# Altium schematic sheet Motor Connection V1.SchDoc: Motor Connection V1
size 302 x 228 mm; Origin: Eagle; Date: 5/3/2022 12:35:28 PM; SheetNumber: 1; GateName_1: G$1; SymbolName_1: FR-A4L; LibraryName: SparkFun-Aesthetics; DeviceSetName: FRAME-A4L; Sheet: Sheet:; CNAME: >CNAME; REV: V1; DESIGNER: Dharmik Patel; CREVISION: >CREVISION
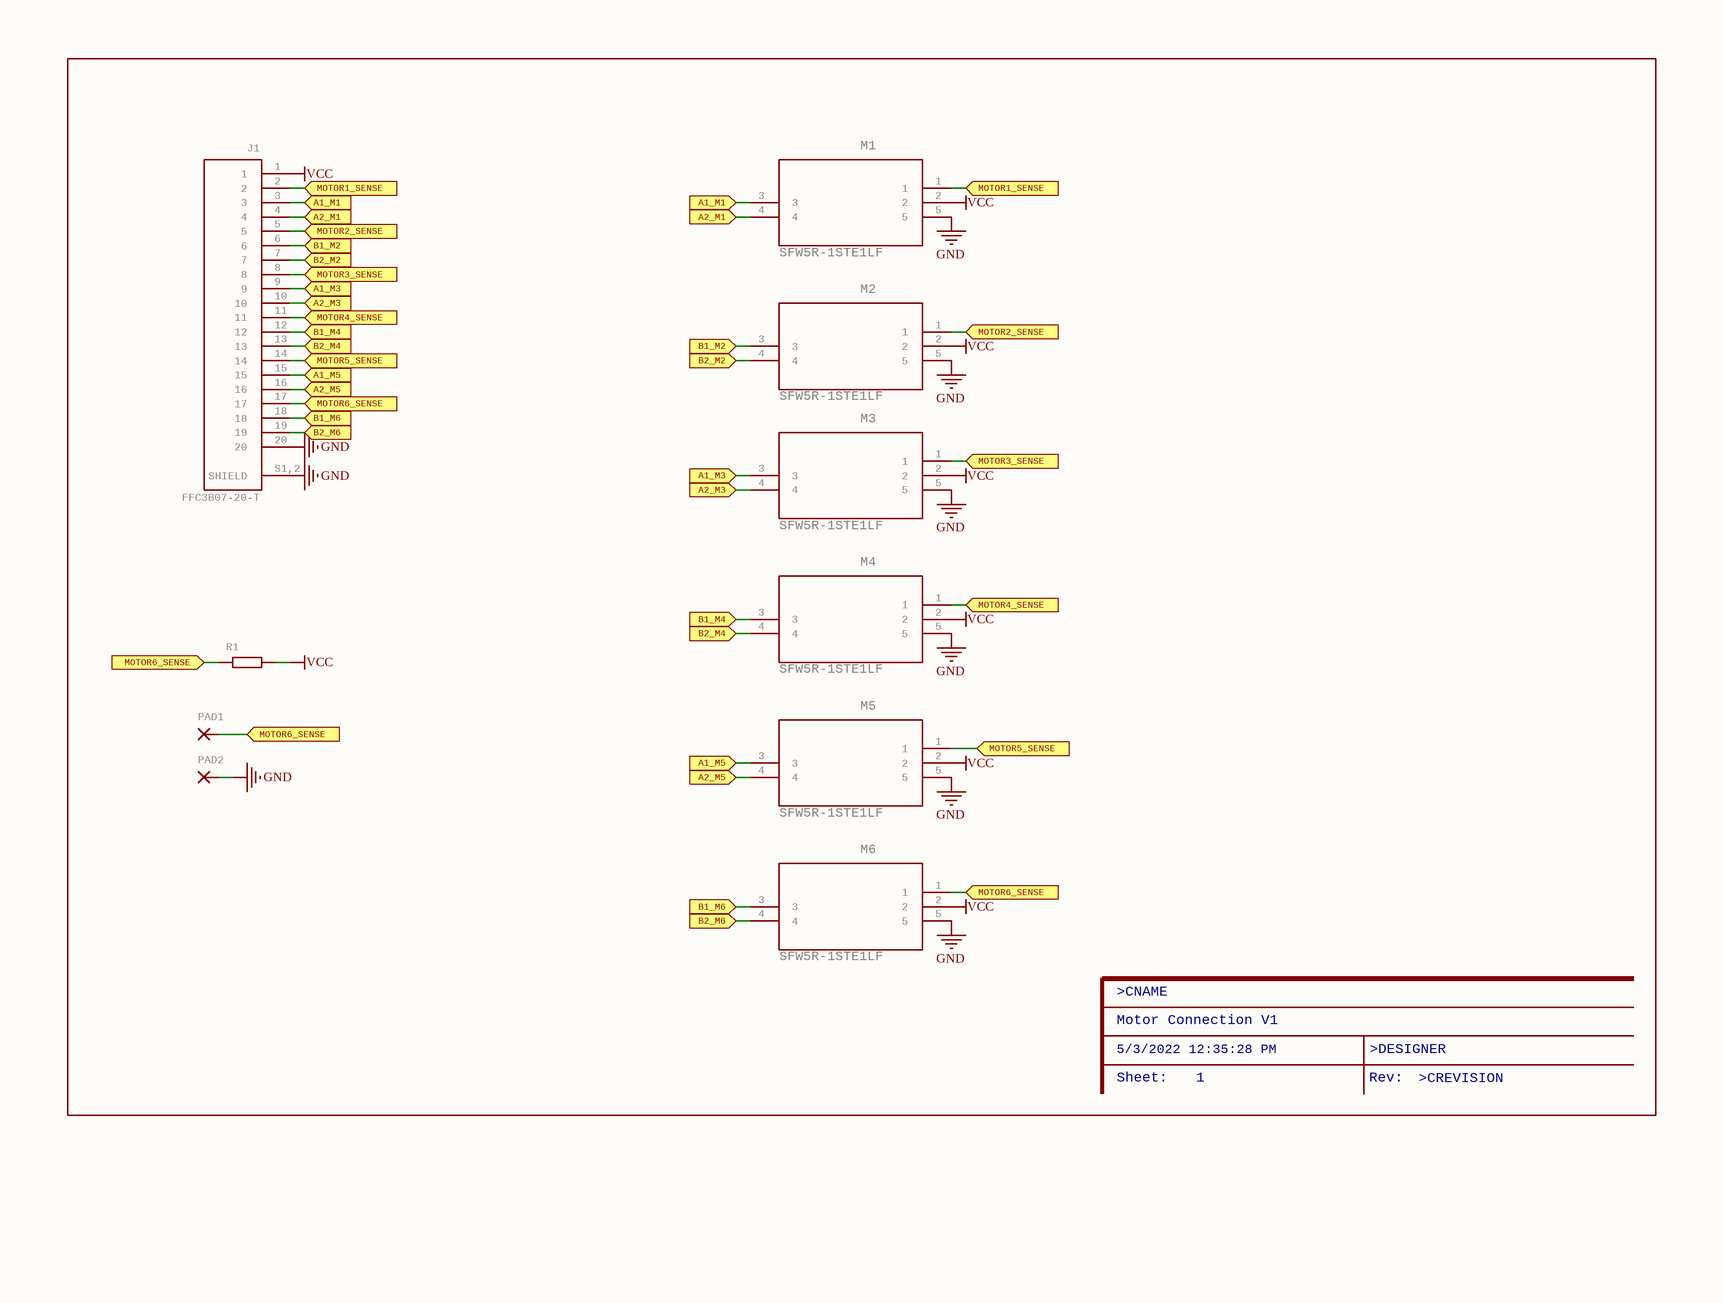
[diagram p0: Motor Connection V1.SchDoc]

## Parts
J1  FFC3B07-20-T  [GCT_FFC3B07-20-T]
M1  SFW5R-1STE1LF  [FCI_SFW5R-1STE1LF]
M2  SFW5R-1STE1LF  [FCI_SFW5R-1STE1LF]
M3  SFW5R-1STE1LF  [FCI_SFW5R-1STE1LF]
M4  SFW5R-1STE1LF  [FCI_SFW5R-1STE1LF]
M5  SFW5R-1STE1LF  [FCI_SFW5R-1STE1LF]
M6  SFW5R-1STE1LF  [FCI_SFW5R-1STE1LF]
PAD1  SMD2  [SMD1,27-2,54]  (value not drawn)
PAD2  SMD2  [SMD1,27-2,54]  (value not drawn)
R1  R-EU_R0603  [R0603]  (value not drawn)

## Ports
A1_M1 (in), A1_M3 (in), A1_M5 (in), A2_M1 (in), A2_M3 (in), A2_M5 (in), B1_M2 (in), B1_M4 (in), B1_M6 (in), B2_M2 (in), B2_M4 (in), B2_M6 (in), MOTOR1_SENSE (in), MOTOR2_SENSE (in), MOTOR3_SENSE (in), MOTOR4_SENSE (in), MOTOR5_SENSE (in), MOTOR6_SENSE (in)

## Nets
GND: J1.20 J1.S1,2(SHIELD) M1.5 M2.5 M3.5 M4.5 M5.5 M6.5 PAD2.1(P)
VCC: J1.1 M1.2 M2.2 M3.2 M4.2 M5.2 M6.2 R1.2
A1_M1: J1.3 M1.3 ; port A1_M1
A1_M3: J1.9 M3.3 ; port A1_M3
A1_M5: J1.15 M5.3 ; port A1_M5
A2_M1: J1.4 M1.4 ; port A2_M1
A2_M3: J1.10 M3.4 ; port A2_M3
A2_M5: J1.16 M5.4 ; port A2_M5
B1_M2: J1.6 M2.3 ; port B1_M2
B1_M4: J1.12 M4.3 ; port B1_M4
B1_M6: J1.18 M6.3 ; port B1_M6
B2_M2: J1.7 M2.4 ; port B2_M2
B2_M4: J1.13 M4.4 ; port B2_M4
B2_M6: J1.19 M6.4 ; port B2_M6
MOTOR1_SENSE: J1.2 M1.1 ; port MOTOR1_SENSE
MOTOR2_SENSE: J1.5 M2.1 ; port MOTOR2_SENSE
MOTOR3_SENSE: J1.8 M3.1 ; port MOTOR3_SENSE
MOTOR4_SENSE: J1.11 M4.1 ; port MOTOR4_SENSE
MOTOR5_SENSE: J1.14 M5.1 ; port MOTOR5_SENSE
MOTOR6_SENSE: J1.17 M6.1 PAD1.1(P) R1.1 ; port MOTOR6_SENSE

## Notes on the sheet
- Motor Connection V1
- >CNAME
- 5/3/2022 12:35:28 PM
- Sheet:
- 1
- Rev:
- >DESIGNER
- >CREVISION

## Library data of the parts
J1 = FFC3B07-20-T: FPC 1.0mm Pitch, Side entry, Top contact, SMT, Height 2.5mm, Slide type Check availability; GateName_1: G$1; MF: Global Connector Technology; SymbolName_1: FFC3B07-20-T; LibraryName: FFC3B07-20-T; DeviceSetName: FFC3B07-20-T; AVAILABILITY: In Stock; MP: FFC3B07-20-T; PACKAGE: None; PRICE: None; PURCHASE-URL: https://pricing.snapeda.com/search/part/FFC3B07-20-T/?ref=eda
M1-M6 = SFW5R-1STE1LF: FFC/FPC CONNECTOR, RECEPTACLE, 5POS 1ROW; GateName_1: A; SymbolName_1: SFW5R-1STE1LF; LibraryName: Firgelli SFW5R-1STE1LF; DeviceSetName: SFW5R-1STE1LF; MPN: SFW5R-1STE1LF; OC_FARNELL: 1835598; OC_NEWARK: 62K5638; PACKAGE: CONNECTOR-5POS; SUPPLIER: FCI
PAD1 PAD2 = SMD2: SMD PAD; GateName_1: 1; POPULARITY: 15; SymbolName_1: PAD; LibraryName: dharmik-wirepad; DeviceSetName: SMD2
R1 = R-EU_R0603: RESISTOR, European symbol; GateName_1: G$1; SymbolName_1: R-EU-1; DeviceSetName: R-EU_; DeviceName: R0603; LibraryName: Capasitor_dharmiks